# Altium schematic sheet BMS_Schematic1.schdoc
size 289 x 200 mm; Name: default297x210; Symbol: default297x210; Device: default297x210; Size: "A4"; Id: /; File: BMS Schematic; Sheet: /; SheetNumber: 14; SheetTotal: 17
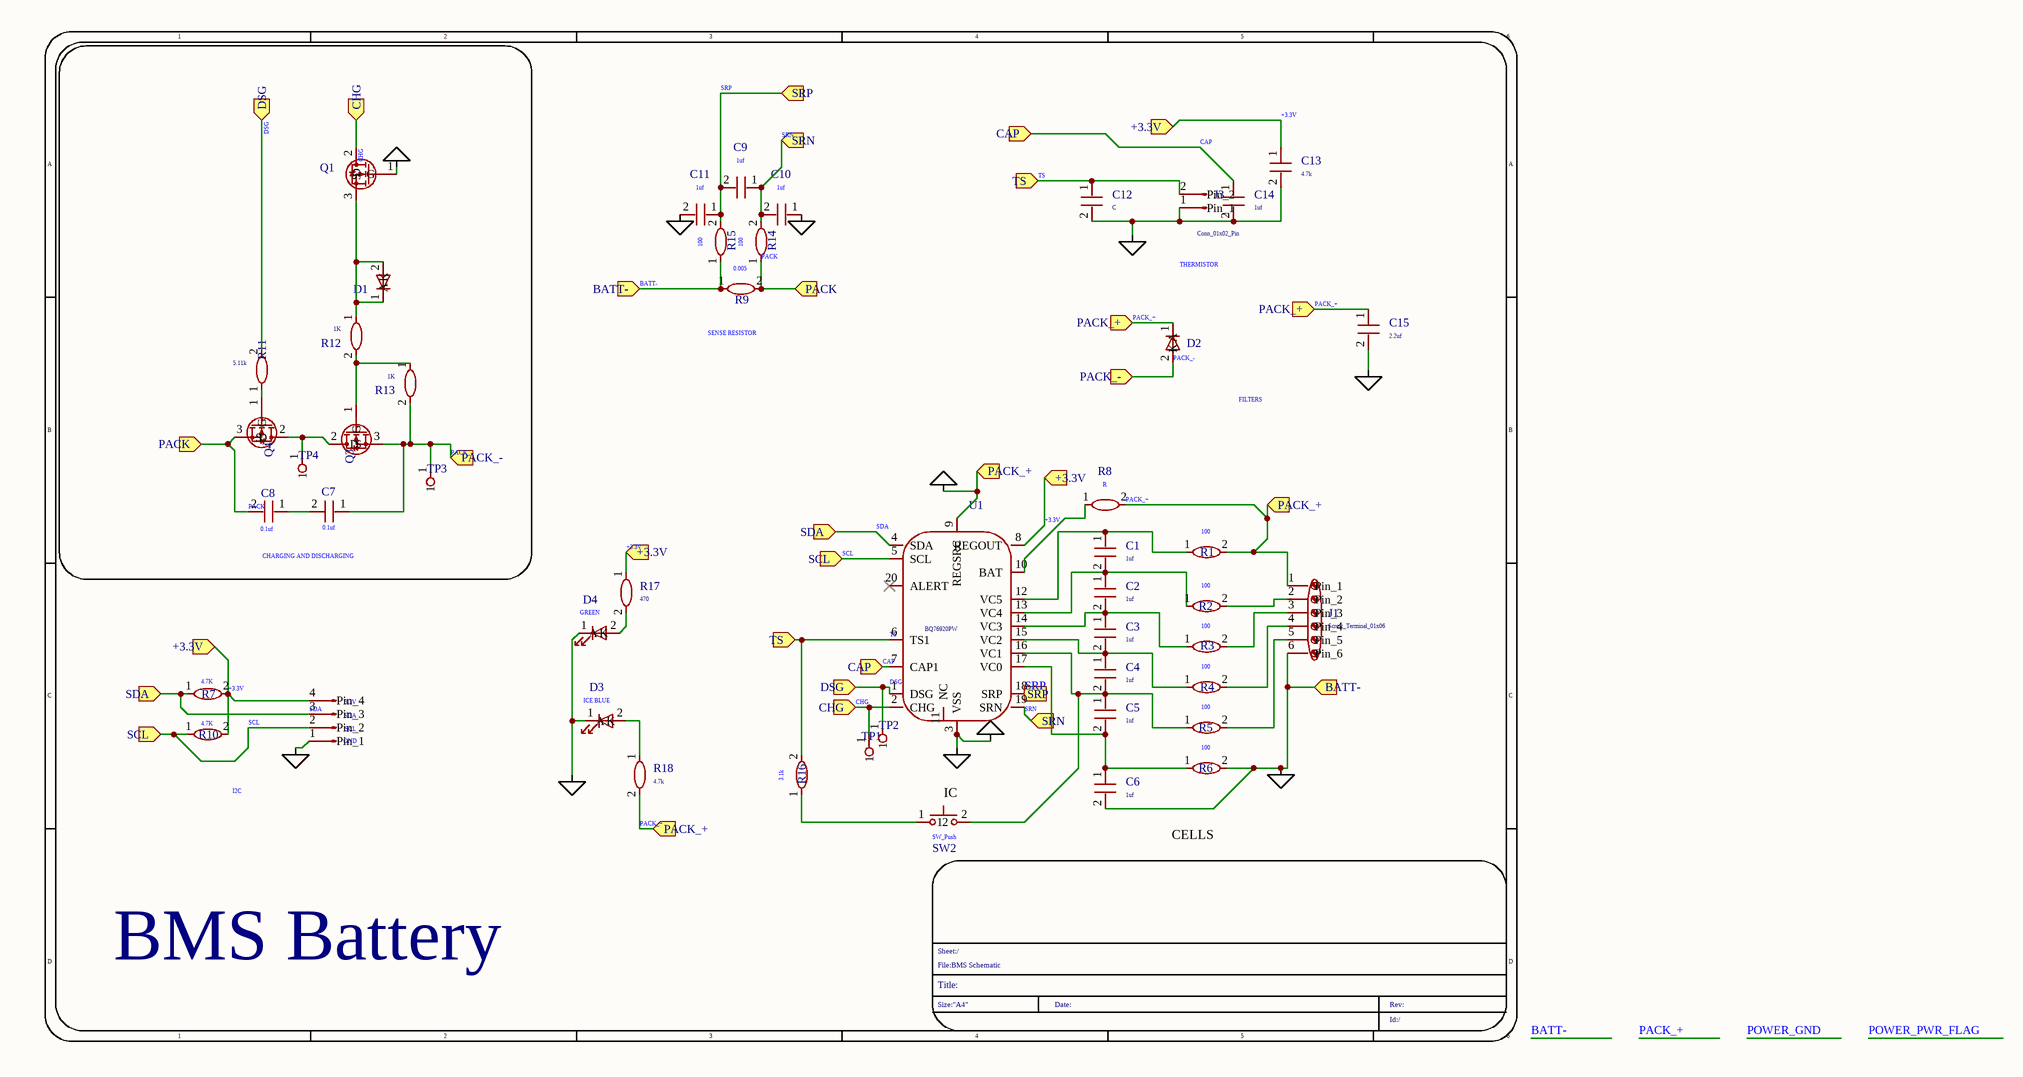
[diagram p0: BMS_Schematic1.schdoc]

## Parts
C1  value 1uf  (hidden comment: Device_C)
C2  value 1uf  (hidden comment: Device_C)
C3  value 1uf  (hidden comment: Device_C)
C4  value 1uf  (hidden comment: Device_C)
C5  value 1uf  (hidden comment: Device_C)
C6  value 1uf  (hidden comment: Device_C)
C7  value 0.1uf  (hidden comment: Device_C)
C8  value 0.1uf  (hidden comment: Device_C)
C9  value 1uf  (hidden comment: Device_C)
C10  value 1uf  (hidden comment: Device_C)
C11  value 1uf  (hidden comment: Device_C)
C12  value C  (hidden comment: Device_C)
C13  value 4.7k  (hidden comment: Device_C)
C14  value 1uf  (hidden comment: Device_C)
C15  value 2.2uf  (hidden comment: Device_C)
D1  Device_D  (value not drawn)
D2  Device_D  (value not drawn)
D3  value ICE BLUE  (hidden comment: Device_LED)
D4  value GREEN  (hidden comment: Device_LED)
J1  value Screw_Terminal_01x06  (hidden comment: Connector_Screw_Terminal_01x06)
J2  Connector_Conn_01x04_Pin  (value not drawn)
J3  value Conn_01x02_Pin  (hidden comment: Connector_Conn_01x02_Pin)
Q1  Transistor_FET_IRLZ44N  (value not drawn)
Q3  Transistor_FET_IRLZ44N  (value not drawn)
Q4  Transistor_FET_IRLZ44N  (value not drawn)
R1  value 100  (hidden comment: Device_R)
R2  value 100  (hidden comment: Device_R)
R3  value 100  (hidden comment: Device_R)
R4  value 100  (hidden comment: Device_R)
R5  value 100  (hidden comment: Device_R)
R6  value 100  (hidden comment: Device_R)
R7  value 4.7K  (hidden comment: Device_R)
R8  value R  (hidden comment: Device_R)
R9  value 0.005  (hidden comment: Device_R)
R10  value 4.7K  (hidden comment: Device_R)
R11  value 5.11k  (hidden comment: Device_R)
R12  value 1K  (hidden comment: Device_R)
R13  value 1K  (hidden comment: Device_R)
R14  value 100  (hidden comment: Device_R)
R15  value 100  (hidden comment: Device_R)
R16  value 3.1k  (hidden comment: Device_R)
R17  value 470  (hidden comment: Device_R)
R18  value 4.7k  (hidden comment: Device_R)
SW2  value SW_Push  (hidden comment: Switch_SW_Push)
TP1  Connector_TestPoint  (value not drawn)
TP2  Connector_TestPoint  (value not drawn)
TP3  Connector_TestPoint  (value not drawn)
TP4  Connector_TestPoint  (value not drawn)
U1  value BQ76920PW  (hidden comment: Battery_Management_BQ76920PW)

## Blocks framed on the sheet
CHARGING AND DISCHARGING: C7 C8 D1 Q1 Q3 Q4 R11-R13 TP3 TP4

## Ports
+3.3V (in), BATT- (in), CAP (in), CHG (in), DSG (in), PACK (in), PACK_+ (in), PACK_- (in), SCL (in), SDA (in), SRN (in), SRP (in), TS (in)

## Nets
BATT-: C6.2 C10.1 C11.2 C12.2 C13.2 C14.2 C15.1 C15.2 D2.1(K) D3.1(K) D4.1(K) J1.1(Pin_1) J1.6(Pin_6) J2.1(Pin_1) J3.1(Pin_1) Q1.1(G) R1.2 R6.2 R8.2 R9.1 R15.1 R18.2 U1.3(VSS) U1.9(REGSRC) ; port PACK_+, port BATT-  [also labelled PACK_+, POWER_GND, POWER_PWR_FLAG]
+3.3V: C13.1 J2.4(Pin_4) R7.2 R10.2 R17.1 U1.8(REGOUT) ; port +3.3V
CAP: C14.1 U1.7(CAP1) ; port CAP
CHG: Q1.2(D) TP1.1 U1.2(CHG) ; port CHG
DSG: R11.2 TP2.1 U1.1(DSG) ; port DSG
PACK: C8.2 Q4.3(S) R9.2 R14.1 ; port PACK
PACK_-: C7.1 D2.2(A) Q3.3(S) R13.2 TP3.1 ; port PACK_-
SCL: J2.2(Pin_2) R10.1 U1.5(SCL) ; port SCL
SDA: J2.3(Pin_3) R7.1 U1.4(SDA) ; port SDA
SRN: C9.1 C10.2 R14.2 U1.19(SRN) ; port SRN
SRP: C9.2 C11.1 R15.2 U1.18(SRP) ; port SRP
TS: C12.1 J3.2(Pin_2) R16.2 U1.6(TS1) ; port TS
NetC1_1: C1.1 R1.1 U1.12(VC5)
NetC1_2: C1.2 C2.1 R2.1 U1.13(VC4)
NetC2_2: C2.2 C3.1 R3.1 U1.14(VC3)
NetC3_2: C3.2 C4.1 R4.1 U1.15(VC2)
NetC4_2: C4.2 C5.1 R5.1 SW2.2 U1.16(VC1)
NetC5_2: C5.2 C6.1 R6.1 U1.17(VC0)
NetC7_2: C7.2 C8.1
NetD1_1: D1.1(K) D1.2(A) Q1.3(S) R12.1
NetD3_2: D3.2(A) R18.1
NetD4_2: D4.2(A) R17.2
NetJ1_2: J1.2(Pin_2) R2.2
NetJ1_3: J1.3(Pin_3) R3.2
NetJ1_4: J1.4(Pin_4) R4.2
NetJ1_5: J1.5(Pin_5) R5.2
NetQ3_1: Q3.1(G) R12.2 R13.1
NetQ3_2: Q3.2(D) Q4.2(D) TP4.1
NetQ4_1: Q4.1(G) R11.1
NetR8_1: R8.1 U1.10(BAT)
NetR16_1: R16.1 SW2.1

Not connected (* = marked no-connect by the designer): U1 11(NC) 20(ALERT)*

## Notes on the sheet
- THERMISTOR
- (near R9) SENSE RESISTOR
- FILTERS
- (near J2) GND
- (near J2) SCL
- (near J2) 3.3V
- (near J2) SDA
- I2C
- (near SW2) IC
- CELLS
- BMS Battery
- 1
- 2
- 3
- 4
- 5
- 6
- A
- B
- C
- D
- File:BMS Schematic
- Sheet:/
- Size:"A4"
- Title:
- Date:
- Rev:
- Id:/

## Library data of the parts
C1-C15 = Device_C: Add into BOM: yes; Origin Footprint: Capacitor_SMD:C_0603_1608Metric_Pad1.08x0.95mm_HandSolder; Symbol: Device_C; Device: Device_C; User doc link: ~; Convert to PCB: yes
D1 = Device_D: Value: D; Sim_Pins: 1=K 2=A; Add into BOM: yes; Origin Footprint: Diode_SMD:D_0201_0603Metric; Symbol: Device_D; Device: Device_D; User doc link: ~; Sim_Device: D; Convert to PCB: yes; Sim.Device: D; Sim.Pins: 1=K 2=A
D2 = Device_D: Value: 30V; Sim_Device: D; Sim_Pins: 1=K 2=A; Add into BOM: yes; Origin Footprint: Diode_SMD:D_0201_0603Metric; Symbol: Device_D; Device: Device_D; User doc link: ~; Convert to PCB: yes; Sim.Device: D; Sim.Pins: 1=K 2=A
D3 D4 = Device_LED: Sim_Pins: 1=K 2=A; Add into BOM: yes; Origin Footprint: LED_SMD:LED_0805_2012Metric; Symbol: Device_LED; Device: Device_LED; User doc link: ~; Convert to PCB: yes; Sim.Pins: 1=K 2=A
J1 = Connector_Screw_Terminal_01x06: Add into BOM: yes; Origin Footprint: TerminalBlock:TerminalBlock_Xinya_XY308-2.54-6P_1x06_P2.54mm_Horizontal; Symbol: Connector_Screw_Terminal_01x06; Device: Connector_Screw_Terminal_01x06; User doc link: ~; Convert to PCB: yes
J2 = Connector_Conn_01x04_Pin: Add into BOM: yes; Origin Footprint: Connector_Samtec_HPM_THT:Samtec_HPM-04-01-x-S_Straight_1x04_Pitch5.08mm; Symbol: Connector_Conn_01x04_Pin; Device: Connector_Conn_01x04_Pin; Value: Conn_01x04_Pin; User doc link: ~; Convert to PCB: yes
J3 = Connector_Conn_01x02_Pin: Add into BOM: yes; Origin Footprint: Connector_Samtec_HPM_THT:Samtec_HPM-02-01-x-S_Straight_1x02_Pitch5.08mm; Symbol: Connector_Conn_01x02_Pin; Device: Connector_Conn_01x02_Pin; User doc link: ~; Convert to PCB: yes
Q1 Q3 Q4 = Transistor_FET_IRLZ44N: Add into BOM: yes; Origin Footprint: Package_TO_SOT_THT:TO-220-3_Vertical; Symbol: Transistor_FET_IRLZ44N; Device: Transistor_FET_IRLZ44N; Value: IRLZ44N; User doc link: http://www.irf.com/product-info/datasheets/data/irlz44n.pdf; Convert to PCB: yes
R1-R8 R10-R18 = Device_R: Add into BOM: yes; Origin Footprint: Resistor_SMD:R_0603_1608Metric_Pad0.98x0.95mm_HandSolder; Symbol: Device_R; Device: Device_R; User doc link: ~; Convert to PCB: yes
R9 = Device_R: Add into BOM: yes; Origin Footprint: Resistor_SMD:R_2512_6332Metric_Pad1.40x3.35mm_HandSolder; Symbol: Device_R; Device: Device_R; User doc link: ~; Convert to PCB: yes
SW2 = Switch_SW_Push: Add into BOM: yes; Origin Footprint: Button_Switch_SMD:SW_Tactile_SPST_NO_Straight_CK_PTS636Sx25SMTRLFS; Symbol: Switch_SW_Push; Device: Switch_SW_Push; User doc link: ~; Convert to PCB: yes
TP1-TP4 = Connector_TestPoint: Add into BOM: yes; Origin Footprint: TestPoint:TestPoint_THTPad_D1.0mm_Drill0.5mm; Symbol: Connector_TestPoint; Device: Connector_TestPoint; Value: TestPoint; User doc link: ~; Convert to PCB: yes
U1 = Battery_Management_BQ76920PW: Add into BOM: yes; Origin Footprint: Package_SO:TSSOP-20_4.4x6.5mm_P0.65mm; Symbol: Battery_Management_BQ76920PW; Device: Battery_Management_BQ76920PW; User doc link: http://www.ti.com/lit/ds/symlink/bq76920.pdf; Convert to PCB: yes